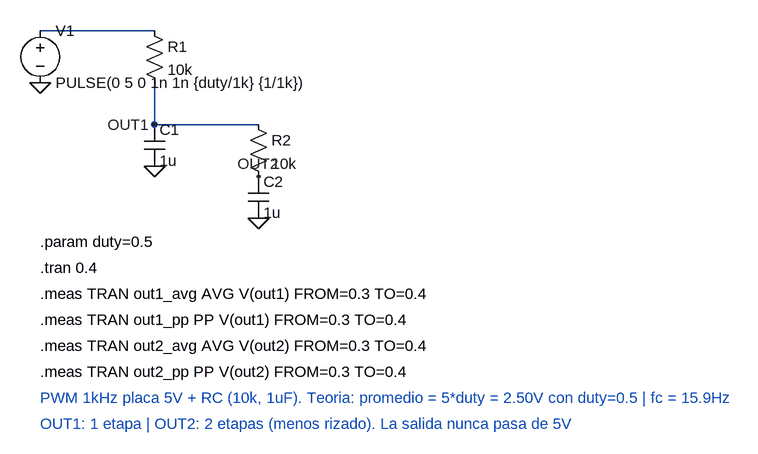
[diagram p0: schematic dac_pwm_rc.asc]
dac_pwm_rc.asc, the LTspice schematic file:
Version 4
SHEET 1 880 680
WIRE 0 16 176 16
WIRE 176 96 176 160
WIRE 176 160 336 160
FLAG 0 96 0
FLAG 176 160 OUT1
FLAG 176 224 0
FLAG 336 240 OUT2
FLAG 336 304 0
SYMBOL voltage 0 0 R0
SYMATTR InstName V1
SYMATTR Value PULSE(0 5 0 1n 1n {duty/1k} {1/1k})
SYMBOL res 160 0 R0
SYMATTR InstName R1
SYMATTR Value 10k
SYMBOL cap 160 160 R0
SYMATTR InstName C1
SYMATTR Value 1u
SYMBOL res 320 144 R0
SYMATTR InstName R2
SYMATTR Value 10k
SYMBOL cap 320 240 R0
SYMATTR InstName C2
SYMATTR Value 1u
TEXT 0 340 Left 2 !.param duty=0.5
TEXT 0 380 Left 2 !.tran 0.4
TEXT 0 420 Left 2 !.meas TRAN out1_avg AVG V(out1) FROM=0.3 TO=0.4
TEXT 0 460 Left 2 !.meas TRAN out1_pp PP V(out1) FROM=0.3 TO=0.4
TEXT 0 500 Left 2 !.meas TRAN out2_avg AVG V(out2) FROM=0.3 TO=0.4
TEXT 0 540 Left 2 !.meas TRAN out2_pp PP V(out2) FROM=0.3 TO=0.4
TEXT 0 580 Left 2 ;PWM 1kHz placa 5V + RC (10k, 1uF). Teoria: promedio = 5*duty = 2.50V con duty=0.5 | fc = 15.9Hz
TEXT 0 620 Left 2 ;OUT1: 1 etapa | OUT2: 2 etapas (menos rizado). La salida nunca pasa de 5V

The netlist it stands for:
* dac_pwm_rc.asc
V1 N001 0 PULSE(0 5 0 1n 1n {duty/1k} {1/1k})
R1 N001 OUT1 10k
C1 OUT1 0 1u
R2 OUT1 OUT2 10k
C2 OUT2 0 1u
.param duty=0.5
.tran 0.4
.meas TRAN out1_avg AVG V(out1) FROM=0.3 TO=0.4
.meas TRAN out1_pp PP V(out1) FROM=0.3 TO=0.4
.meas TRAN out2_avg AVG V(out2) FROM=0.3 TO=0.4
.meas TRAN out2_pp PP V(out2) FROM=0.3 TO=0.4
* PWM 1kHz placa 5V + RC (10k, 1uF). Teoria: promedio = 5*duty = 2.50V con duty=0.5 | fc = 15.9Hz
* OUT1: 1 etapa | OUT2: 2 etapas (menos rizado). La salida nunca pasa de 5V
.backanno
.end